# Altium schematic sheet pm.SchDoc
size A4; SheetNumber: 3; SheetTotal: 3
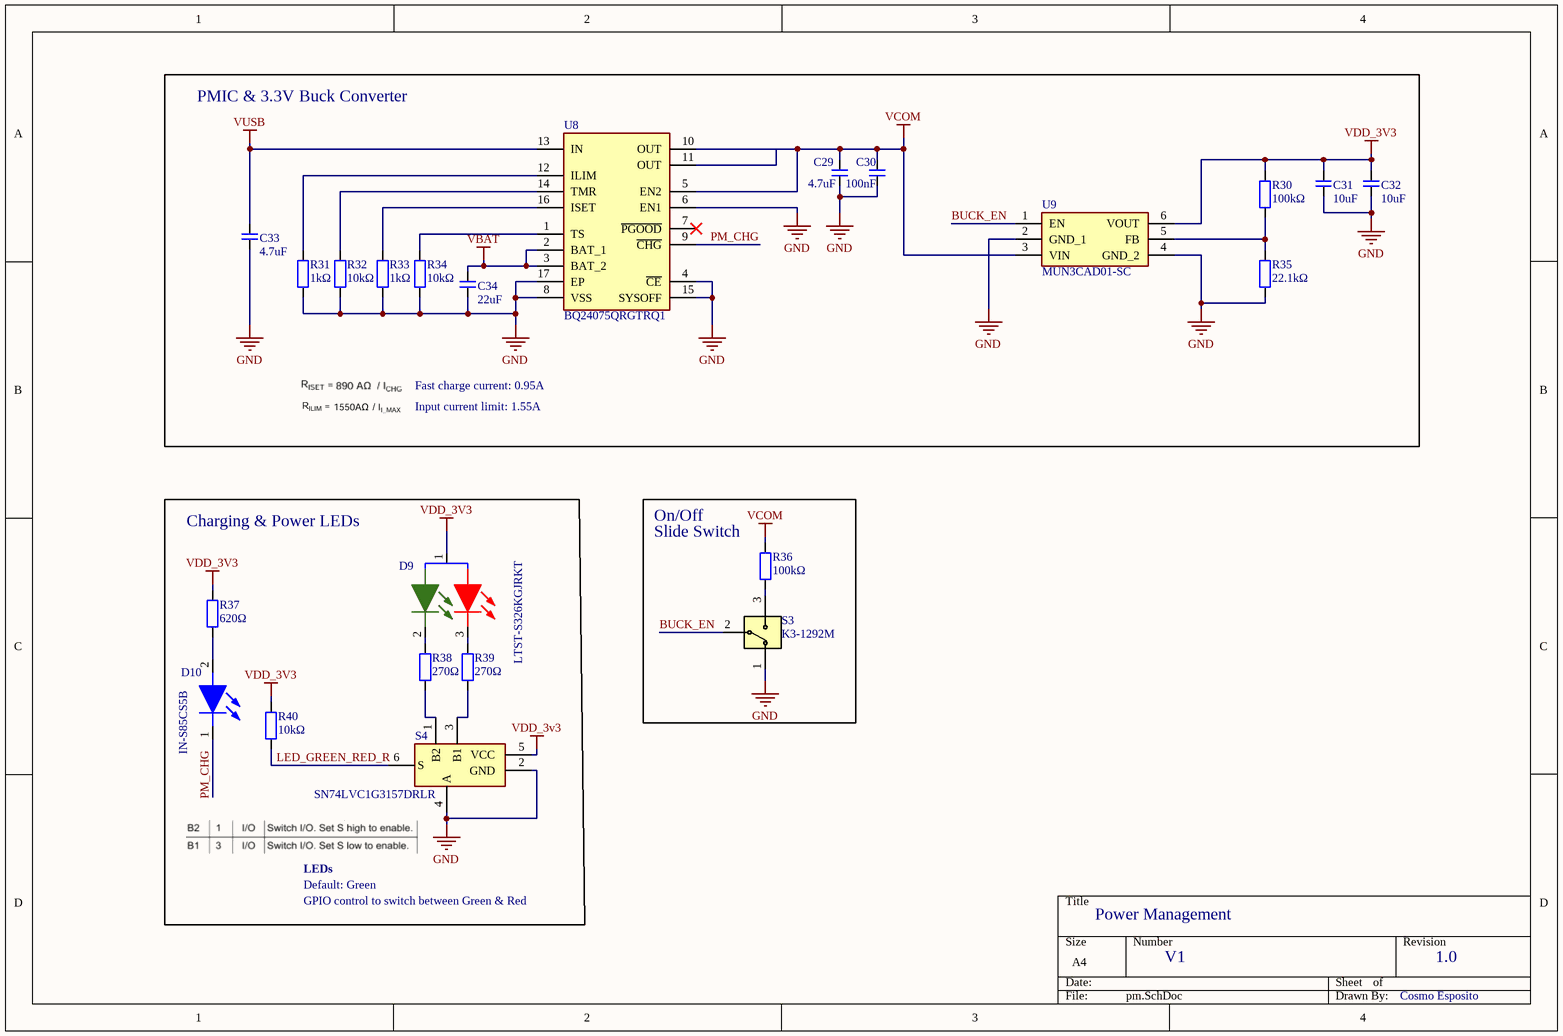
[diagram p0: pm.SchDoc]

## Parts
C29  4.7uF  [0402 (1005 metric) CAP IPC-7351 Level B SMD]
C30  100nF  [0402 (1005 metric) CAP IPC-7351 Level B SMD]
C31  10uF  [0402 (1005 metric) CAP IPC-7351 Level B SMD]
C32  10uF  [0402 (1005 metric) CAP IPC-7351 Level B SMD]
C33  4.7uF  [0603 (1608 metric) CAP IPC-7351 Level B SMD]
C34  22uF  [0603 (1608 metric) CAP IPC-7351 Level B SMD]
D9  LTST-S326KGJRKT  [LTST-S326KGJRKT]
D10  IN-S85CS5B  [INS85CS5B]
R30  100kΩ  [0402 (1005 metric) RES IPC-7351 Level B SMD]
R31  1kΩ  [0402 (1005 metric) RES IPC-7351 Level B SMD]
R32  10kΩ  [0402 (1005 metric) RES IPC-7351 Level B SMD]
R33  1kΩ  [0402 (1005 metric) RES IPC-7351 Level B SMD]
R34  10kΩ  [0402 (1005 metric) RES IPC-7351 Level B SMD]
R35  22.1kΩ  [0402 (1005 metric) RES IPC-7351 Level B SMD]
R36  100kΩ  [0402 (1005 metric) RES IPC-7351 Level B SMD]
R37  620Ω  [0402 (1005 metric) RES IPC-7351 Level B SMD]
R38  270Ω  [0402 (1005 metric) RES IPC-7351 Level B SMD]
R39  270Ω  [0402 (1005 metric) RES IPC-7351 Level B SMD]
R40  10kΩ  [0402 (1005 metric) RES IPC-7351 Level B SMD]
S3  K3-1292M  [K3-1292M]
S4  SN74LVC1G3157DRLR  [SOTFL50P160X60-6N]
U8  BQ24075QRGTRQ1  [QFN50P300X300X100-17N-D]
U9  MUN3CAD01-SC  [MUN3CAD01SC]

## Blocks framed on the sheet
PMIC & 3.3V Buck Converter: C29-C34 R30-R35 U8 U9
Charging & Power LEDs: D9 D10 R37-R40 S4

## Nets
GND: C29.1 C30.1 C31.1 C32.1 C33.1 C34.1 R31.2 R32.2 R33.2 R34.2 R35.2 S3.1 S4.2(GND) S4.4(A) U8.4(~{CE}) U8.6(EN1) U8.8(VSS) U8.15(SYSOFF) U8.17(EP) U9.2(GND_1) U9.4(GND_2)
VBAT: C34.2 U8.2(BAT_1) U8.3(BAT_2)
VCOM: C29.2 C30.2 R36.2 U8.5(EN2) U8.10(OUT) U8.11(OUT) U9.3(VIN)
VDD_3V3: C31.2 C32.2 D9.1(A) R30.1 R37.2 R40.1 S4.5(VCC) U9.6(VOUT)
VUSB: C33.2 U8.13(IN)
BUCK_EN: S3.2 U9.1(EN)
LED_GREEN_RED_R: R40.2 S4.6(S)
PM_CHG: D10.1(K) U8.9(~{CHG})
NetD9_2: D9.2(K) R38.2
NetD9_3: D9.3(K) R39.2
NetD10_2: D10.2(A) R37.1
NetR30_2: R30.2 R35.1 U9.5(FB)
NetR31_1: R31.1 U8.12(ILIM)
NetR32_1: R32.1 U8.14(TMR)
NetR33_1: R33.1 U8.16(ISET)
NetR34_1: R34.1 U8.1(TS)
NetR36_1: R36.1 S3.3
NetR38_1: R38.1 S4.1(B2)
NetR39_1: R39.1 S4.3(B1)

Not connected (* = marked no-connect by the designer): U8 7(~{PGOOD})*

## Notes on the sheet
- Input current limit: 1.55A
- Fast charge current: 0.95A
- On/Off
- (near R36) Slide Switch
- Default: Green
- GPIO control to switch between Green & Red
- LEDs
- Power Management
- V1
- 1.0
- Cosmo Esposito

## Library data of the parts
C29-C34 = Capacitor Type1
  C29 C33: Value: 4.7uF
  C30: Value: 100nF
  C31 C32: Value: 10uF
  C34: Value: 22uF
D9 = LTST-S326KGJRKT: Red / Green standard LED; Manufacturer_Name: Lite-On; Datasheet Link: http://optoelectronics.liteon.com/upload/download/DS22-2000-287/LTST-S326KGJRKT.pdf; Manufacturer_Part_Number: LTST-S326KGJRKT; Mouser Part Number: 859-LTST-S326KGJRKT; Mouser Price/Stock: https://www.mouser.co.uk/ProductDetail/Lite-On/LTST-S326KGJRKT?qs=sXYjIdLHthxXAK%252B5bY%252BGww%3D%3D; Arrow Part Number: LTST-S326KGJRKT; Arrow Price/Stock: https://www.arrow.com/en/products/ltst-s326kgjrkt/lite-on-technology.html?utm_currency=USD&region=nac
D10 = IN-S85CS5B: Standard LEDs - SMD Blue LED; Manufacturer_Name: Inolux; Geometry.Height: 0.7mm; Mouser Part Number: 743-IN-S85CS5B; Mouser Price/Stock: https://www.mouser.co.uk/ProductDetail/Inolux/IN-S85CS5B?qs=stqOd1AaK79rJ2RZKPoGSg%3D%3D; Manufacturer_Part_Number: IN-S85CS5B; Datasheet Link: https://www.inolux-corp.com/datasheet/SMDLED/Mono%20Color%20Side%20View/IN-S85CS5B_V1.0.pdf
R30-R40 = Resistor Type1
  R30 R36: Value: 100kΩ
  R31 R33: Value: 1kΩ
  R32 R34 R40: Value: 10kΩ
  R35: Value: 22.1kΩ
  R37: Value: 620Ω
  R38 R39: Value: 270Ω
S3 = K3-1292M: Toggle Switches 5*2.75mm RoHS; Manufacturer_Name: Korean Hroparts Elec; Geometry.Height: 1.4mm; Manufacturer_Part_Number: K3-1292M; Mouser Part Number: *; Mouser Price/Stock: *; Arrow Part Number: *; Arrow Price/Stock: *; Datasheet Link: https://datasheet.lcsc.com/szlcsc/Korean-Hroparts-Elec-K3-1293S-E2_C145852.pdf
S4 = SN74LVC1G3157DRLR: Single-Pole, Double-Throw Analog Switch; Manufacturer_Name: Texas Instruments; Geometry.Height: 0.6mm; Mouser Part Number: 595-SN74LVC1G3157DRL; Mouser Price/Stock: https://www.mouser.co.uk/ProductDetail/Texas-Instruments/SN74LVC1G3157DRLR?qs=PVVDbbWpW3LmfSj83Os0NA%3D%3D; Manufacturer_Part_Number: SN74LVC1G3157DRLR; Datasheet Link: http://www.ti.com/lit/gpn/sn74lvc1g3157
U8 = BQ24075QRGTRQ1: Automotive 4.35V to 16V, 1.5A Li-Ion Charger with Power-Path Management for 5.5V Systems; Manufacturer_Name: Texas Instruments; Geometry.Height: 1mm; Mouser Part Number: 595-BQ24075QRGTRQ1; Mouser Price/Stock: https://www.mouser.co.uk/ProductDetail/Texas-Instruments/BQ24075QRGTRQ1?qs=i8JZjLRTtkLLeOPMlhTMpg%3D%3D; Manufacturer_Part_Number: BQ24075QRGTRQ1; Datasheet Link: http://www.ti.com/lit/gpn/bq24075-q1
U9 = MUN3CAD01-SC: DC DC CONVERTER 0.8-4V; Manufacturer_Name: Delta Electronics; Geometry.Height: 1.05mm; Manufacturer_Part_Number: MUN3CAD01-SC; Mouser Part Number: 108-MUN3CAD01-SC; Mouser Price/Stock: https://www.mouser.co.uk/ProductDetail/Delta-Electronics/MUN3CAD01-SC?qs=t7xnP681wgVWBGFjFLJIqQ%3D%3D; Arrow Part Number: *; Arrow Price/Stock: *; Datasheet Link: https://www.cyntec.com/upfile/products/download/Cyntec%20MUN3CAD01-SC_Datasheet%2007.pdf